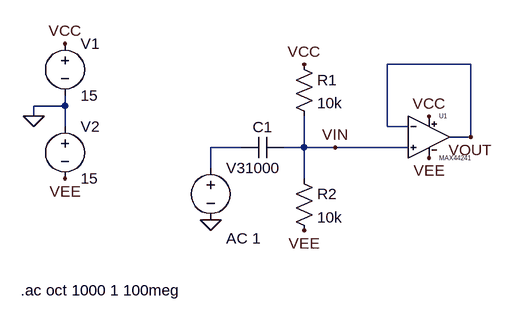
[diagram p0: schematic max44241_bandwidth.asc]
max44241_bandwidth.asc, the LTspice schematic file:
Version 4
SHEET 1 880 680
WIRE 256 48 128 48
WIRE -368 112 -368 96
WIRE -368 112 -416 112
WIRE -416 128 -416 112
WIRE -368 144 -368 112
WIRE 128 144 128 48
WIRE 160 144 128 144
WIRE 256 160 256 48
WIRE 256 160 224 160
WIRE -96 176 -144 176
WIRE 0 176 0 128
WIRE 0 176 -32 176
WIRE 48 176 0 176
WIRE 160 176 48 176
WIRE -144 208 -144 176
WIRE 0 224 0 176
FLAG -416 128 0
FLAG -368 16 VCC
FLAG 192 128 VCC
FLAG -368 224 VEE
FLAG 192 192 VEE
FLAG 256 160 VOUT
FLAG 0 304 VEE
FLAG 0 48 VCC
FLAG 48 176 VIN
FLAG -144 288 0
SYMBOL voltage -368 0 R0
WINDOW 123 0 0 Left 0
WINDOW 39 0 0 Left 0
SYMATTR InstName V1
SYMATTR Value 15
SYMBOL voltage -368 128 R0
WINDOW 123 0 0 Left 0
WINDOW 39 0 0 Left 0
SYMATTR InstName V2
SYMATTR Value 15
SYMBOL res -16 32 R0
SYMATTR InstName R1
SYMATTR Value 10k
SYMBOL res -16 208 R0
SYMATTR InstName R2
SYMATTR Value 10k
SYMBOL cap -32 160 R90
WINDOW 0 0 32 VBottom 2
WINDOW 3 32 32 VTop 2
SYMATTR InstName C1
SYMATTR Value 1000
SYMBOL voltage -144 192 R0
WINDOW 123 24 124 Left 2
WINDOW 39 0 0 Left 0
SYMATTR InstName V3
SYMATTR Value ""
SYMATTR Value2 AC 1
SYMBOL MAX44241 192 96 R0
SYMATTR InstName U1
TEXT -436 396 Left 2 !.ac oct 1000 1 100meg

The netlist it stands for:
* max44241_bandwidth.asc
V1 VCC 0 15
V2 0 VEE 15
R1 VCC VIN 10k
R2 VIN VEE 10k
C1 VIN N001 1000
V3 N001 0 AC 1
XU1 VIN VOUT VCC VEE VOUT MAX44241  ; pins INA+ INA- VDD VSS OUTA
.ac oct 1000 1 100meg
.lib MAX44241.lib
.backanno
.end